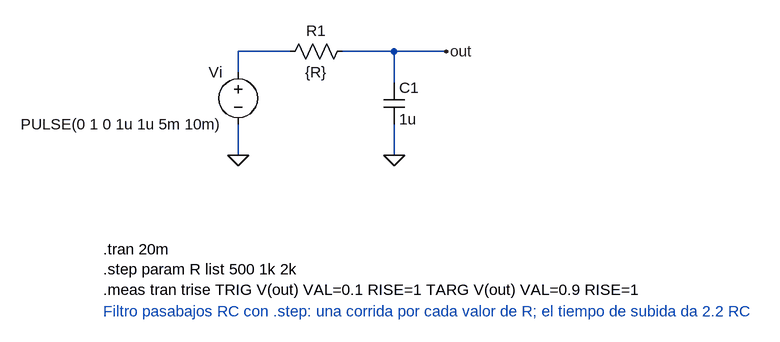
[diagram p0: schematic RC Sweep (.step).asc]
RC Sweep (.step).asc, the LTspice schematic file:
Version 4
SHEET 1 880 680
WIRE 0 0 0 -32
WIRE 0 -32 80 -32
WIRE 160 -32 240 -32
WIRE 240 -32 240 16
WIRE 240 -32 320 -32
WIRE 240 128 240 80
WIRE 0 80 0 128
FLAG 320 -32 out
FLAG 0 128 0
FLAG 240 128 0
SYMBOL voltage 0 -16 M0
WINDOW 0 24 16 Left 2
WINDOW 3 24 96 Left 2
SYMATTR InstName Vi
SYMATTR Value PULSE(0 1 0 1u 1u 5m 10m)
SYMATTR Prefix V
SYMBOL res 176 -48 R90
WINDOW 0 0 56 VBottom 2
WINDOW 3 32 56 VTop 2
SYMATTR InstName R1
SYMATTR Value {R}
SYMATTR Prefix R
SYMBOL cap 224 16 R0
WINDOW 0 24 8 Left 2
WINDOW 3 24 56 Left 2
SYMATTR InstName C1
SYMATTR Value 1u
SYMATTR Prefix C
TEXT -208 272 Left 2 !.tran 20m\n.step param R list 500 1k 2k\n.meas tran trise TRIG V(out) VAL=0.1 RISE=1 TARG V(out) VAL=0.9 RISE=1
TEXT -208 368 Left 2 ;Filtro pasabajos RC con .step: una corrida por cada valor de R; el tiempo de subida da 2.2 RC

The netlist it stands for:
* RC Sweep (.step).asc
Vi N001 0 PULSE(0 1 0 1u 1u 5m 10m)
R1 out N001 {R}
C1 out 0 1u
.tran 20m
.step param R list 500 1k 2k
.meas tran trise TRIG V(out) VAL=0.1 RISE=1 TARG V(out) VAL=0.9 RISE=1
* Filtro pasabajos RC con .step: una corrida por cada valor de R; el tiempo de subida da 2.2 RC
.backanno
.end